# Altium project Flight Controller Core PCB Version.PrjPcb (part 2 of 2)
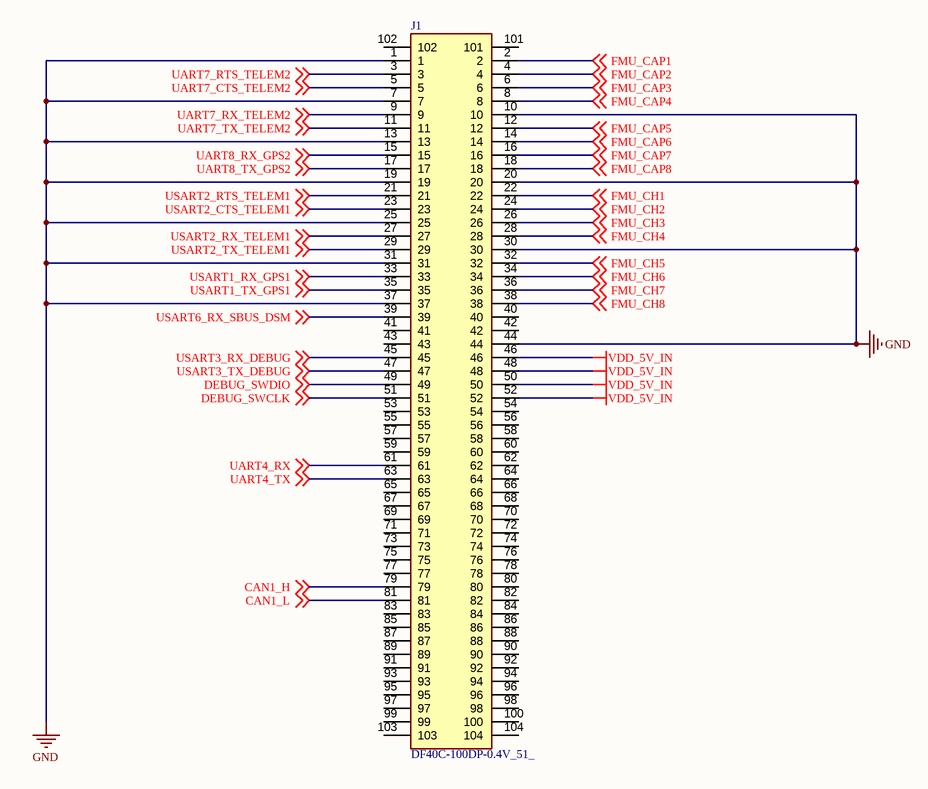
[diagram p8: Connector.SchDoc]

## Nets that join several sheets
GND: MCU (79 pins), Power (17 pins), Imu (18 pins), Barometer (8 pins), Pwm (10 pins), Uart (8 pins), Can (C65.2 IC12.2 IC12.9 IC15.8), Connector (11 pins)
IO_3V3_A: Power (C29.1 IC2.8), Pwm (IC3.1 IC3.2 IC3.23 IC3.24), Uart (5 pins)
IO_3V3_B: Power (C30.1 IC2.7), Pwm (IC4.1 IC4.2 IC4.23 IC4.24), Uart (5 pins)
VDD_5V_IN: Power (7 pins), Can (C65.1 IC12.3), Connector (J1.46 J1.48 J1.50 J1.52)
VDD_MCU: MCU (46 pins), Power (C22.1 IC1.1 IC2.4 IC2.5), Can (IC12.5 IC15.1 R19.2)
VDD_SENSOR: Power (C40.1 IC8.1), Imu (13 pins), Barometer (6 pins)
CAN1_H: Can (IC12.7 R20.1), Connector (J1.79)
CAN1_L: Can (IC12.6 R20.2), Connector (J1.81)
DEBUG_SWCLK: MCU (MCU1_.B14), Connector (J1.51)
DEBUG_SWDIO: MCU (MCU1_.C15), Connector (J1.49)
FDCAN1_RX: MCU (MCU1_.D13), Can (IC12.4)
FDCAN1_TX: MCU (MCU1_.E12), Can (IC12.1)
FMU_CAP1: Pwm (IC4.14), Connector (J1.2)
FMU_CAP2: Pwm (IC4.15), Connector (J1.4)
FMU_CAP3: Pwm (IC4.16), Connector (J1.6)
FMU_CAP4: Pwm (IC4.17), Connector (J1.8)
FMU_CAP5: Pwm (IC4.18), Connector (J1.12)
FMU_CAP6: Pwm (IC4.19), Connector (J1.14)
FMU_CAP7: Pwm (IC4.20), Connector (J1.16)
FMU_CAP8: Pwm (IC4.21), Connector (J1.18)
FMU_CH1: Pwm (IC3.14), Connector (J1.22)
FMU_CH2: Pwm (IC3.15), Connector (J1.24)
FMU_CH3: Pwm (IC3.16), Connector (J1.26)
FMU_CH4: Pwm (IC3.17), Connector (J1.28)
FMU_CH5: Pwm (IC3.18), Connector (J1.32)
FMU_CH6: Pwm (IC3.19), Connector (J1.34)
FMU_CH7: Pwm (IC3.20), Connector (J1.36)
FMU_CH8: Pwm (IC3.21), Connector (J1.38)
LED_BLUE: MCU (MCU1_.U7), Power (DS3.1)
LED_GREEN: MCU (MCU1_.U8), Power (DS2.1)
LED_RED: MCU (MCU1_.T8), Power (DS1.1)
nWP_EEPROM: MCU (MCU1_.E4), Can (IC15.6)
SPI1_DRDY_ICM45686: MCU (MCU1_.P7), Imu (S3.4)
SPI1_MISO: MCU (MCU1_.B7), Imu (S3.1)
SPI1_MOSI: MCU (MCU1_.C11), Imu (S3.14)
SPI1_nCS_ICM45686: MCU (MCU1_.U9), Imu (S3.12)
SPI1_SCK: MCU (MCU1_.C6), Imu (S3.13)
SPI2_DRDY_ICM42688P: MCU (MCU1_.H15), Imu (S1.4)
SPI2_MISO: MCU (MCU1_.M3), Imu (S1.1)
SPI2_MOSI: MCU (MCU1_.C14), Imu (S1.14)
SPI2_nCS_ICM42688P: MCU (MCU1_.T9), Imu (S1.12)
SPI2_SCK: MCU (MCU1_.A15), Imu (S1.13)
SPI4_DRDY_BMI088_ACCEL1: MCU (MCU1_.H14), Imu (S2.16)
SPI4_DRDY_BMI088_ACCEL2: MCU (MCU1_.G14), Imu (S2.1)
SPI4_DRDY_BMI088_GYRO1: MCU (MCU1_.G15), Imu (S2.12)
SPI4_DRDY_BMI088_GYRO2: MCU (MCU1_.F16), Imu (S2.13)
SPI4_DRDY_ICP20100: MCU (MCU1_.F15), Barometer (S6.7)
SPI4_MISO: MCU (MCU1_.D1), Imu (S2.10 S2.15), Barometer (S6.6)
SPI4_MOSI: MCU (MCU1_.E5), Imu (S2.9), Barometer (S6.4)
SPI4_nCS_BMI088_ACCEL: MCU (MCU1_.N9), Imu (S2.14)
SPI4_nCS_BMI088_GYRO: MCU (MCU1_.P10), Imu (S2.5)
SPI4_nCS_ICP20100: MCU (MCU1_.R10), Barometer (S6.1)
SPI4_SCK: MCU (MCU1_.C3), Imu (S2.8), Barometer (S6.2)
SPI5_MISO: MCU (MCU1_.K4), Barometer (S4.6), Can (IC15.4)
SPI5_MOSI: MCU (MCU1_.L14), Barometer (S4.7), Can (IC15.7)
SPI5_nCS_EEPROM: MCU (MCU1_.E2), Can (IC15.2)
SPI5_nCS_MS5611: MCU (MCU1_.T10), Barometer (S4.4 S4.5)
SPI5_SCK: MCU (MCU1_.J14), Barometer (S4.8), Can (IC15.5)
TIM1_CH1: MCU (MCU1_.J15), Pwm (IC3.8)
TIM1_CH2: MCU (MCU1_.K14), Pwm (IC3.9)
TIM1_CH3: MCU (MCU1_.M14), Pwm (IC3.10)
TIM1_CH4: MCU (MCU1_.U10), Pwm (IC3.7)
TIM4_CH1: MCU (MCU1_.R16), Pwm (IC4.10)
TIM4_CH2: MCU (MCU1_.R17), Pwm (IC4.9)
TIM4_CH3: MCU (MCU1_.P16), Pwm (IC4.8)
TIM4_CH4: MCU (MCU1_.P15), Pwm (IC4.7)
TIM5_CH1: MCU (MCU1_.N5), Pwm (IC4.6)
TIM5_CH2: MCU (MCU1_.P14), Pwm (IC4.5)
TIM5_CH3: MCU (MCU1_.R14), Pwm (IC4.4)
TIM5_CH4: MCU (MCU1_.A16), Pwm (IC4.3)
TIM8_CH1: MCU (MCU1_.A3), Pwm (IC3.6)
TIM8_CH2: MCU (MCU1_.A2), Pwm (IC3.4)
TIM8_CH3: MCU (MCU1_.B3), Pwm (IC3.5)
TIM8_CH4: MCU (MCU1_.B15), Pwm (IC3.3)
UART4_RX: MCU (MCU1_.B17), Connector (J1.61)
UART4_TX: MCU (MCU1_.D16), Connector (J1.63)
UART7_CTS: MCU (MCU1_.L4), Uart (IC5.3)
UART7_CTS_TELEM2: Uart (IC5.18), Connector (J1.5)
UART7_RTS: MCU (MCU1_.P9), Uart (IC5.1)
UART7_RTS_TELEM2: Uart (IC5.20), Connector (J1.3)
UART7_RX: MCU (MCU1_.K2), Uart (IC5.4)
UART7_RX_TELEM2: Uart (IC5.17), Connector (J1.9)
UART7_TX: MCU (MCU1_.A14), Uart (IC5.5)
UART7_TX_TELEM2: Uart (IC5.16), Connector (J1.11)
UART8_RX: MCU (MCU1_.C4), Uart (IC5.6)
UART8_RX_GPS2: Uart (IC5.15), Connector (J1.15)
UART8_TX: MCU (MCU1_.B4), Uart (IC5.7)
UART8_TX_GPS2: Uart (IC5.14), Connector (J1.17)
USART1_RX: MCU (MCU1_.D14), Uart (IC6.4)
USART1_RX_GPS1: Uart (IC6.17), Connector (J1.33)
USART1_TX: MCU (MCU1_.U15), Uart (IC6.5)
USART1_TX_GPS1: Uart (IC6.16), Connector (J1.35)
USART2_CTS: MCU (MCU1_.B12), Uart (IC5.9)
USART2_CTS_TELEM1: Uart (IC5.12), Connector (J1.23)
USART2_RTS: MCU (MCU1_.A12), Uart (IC5.8)
USART2_RTS_TELEM1: Uart (IC5.13), Connector (J1.21)
USART2_RX: MCU (MCU1_.B11), Uart (IC6.1)
USART2_RX_TELEM1: Uart (IC6.20), Connector (J1.27)
USART2_TX: MCU (MCU1_.A11), Uart (IC6.3)
USART2_TX_TELEM1: Uart (IC6.18), Connector (J1.29)
USART3_RX: MCU (MCU1_.T17), Uart (IC6.8)
USART3_RX_DEBUG: Uart (IC6.13), Connector (J1.45)
USART3_TX: MCU (MCU1_.U16), Uart (IC6.9)
USART3_TX_DEBUG: Uart (IC6.12), Connector (J1.47)
USART6_RX: MCU (MCU1_.A10), Uart (IC6.6)
USART6_RX_SBUS_DSM: Uart (IC6.15), Connector (J1.39)
VDD_3V3_SENSORS_EN: MCU (MCU1_.D6), Power (IC8.4)